# EAGLE design breakbeam (EAGLE 9.6.1)
DDRAWN: 11/27/2018; FINISH: HASL; MATERIAL: FR-4; NDRAWN: MM; REV: 1.0; REVISION: v1.1; SCALE: 1:1; TEAM: RoboCup; TITLE: SSL Breakbeam
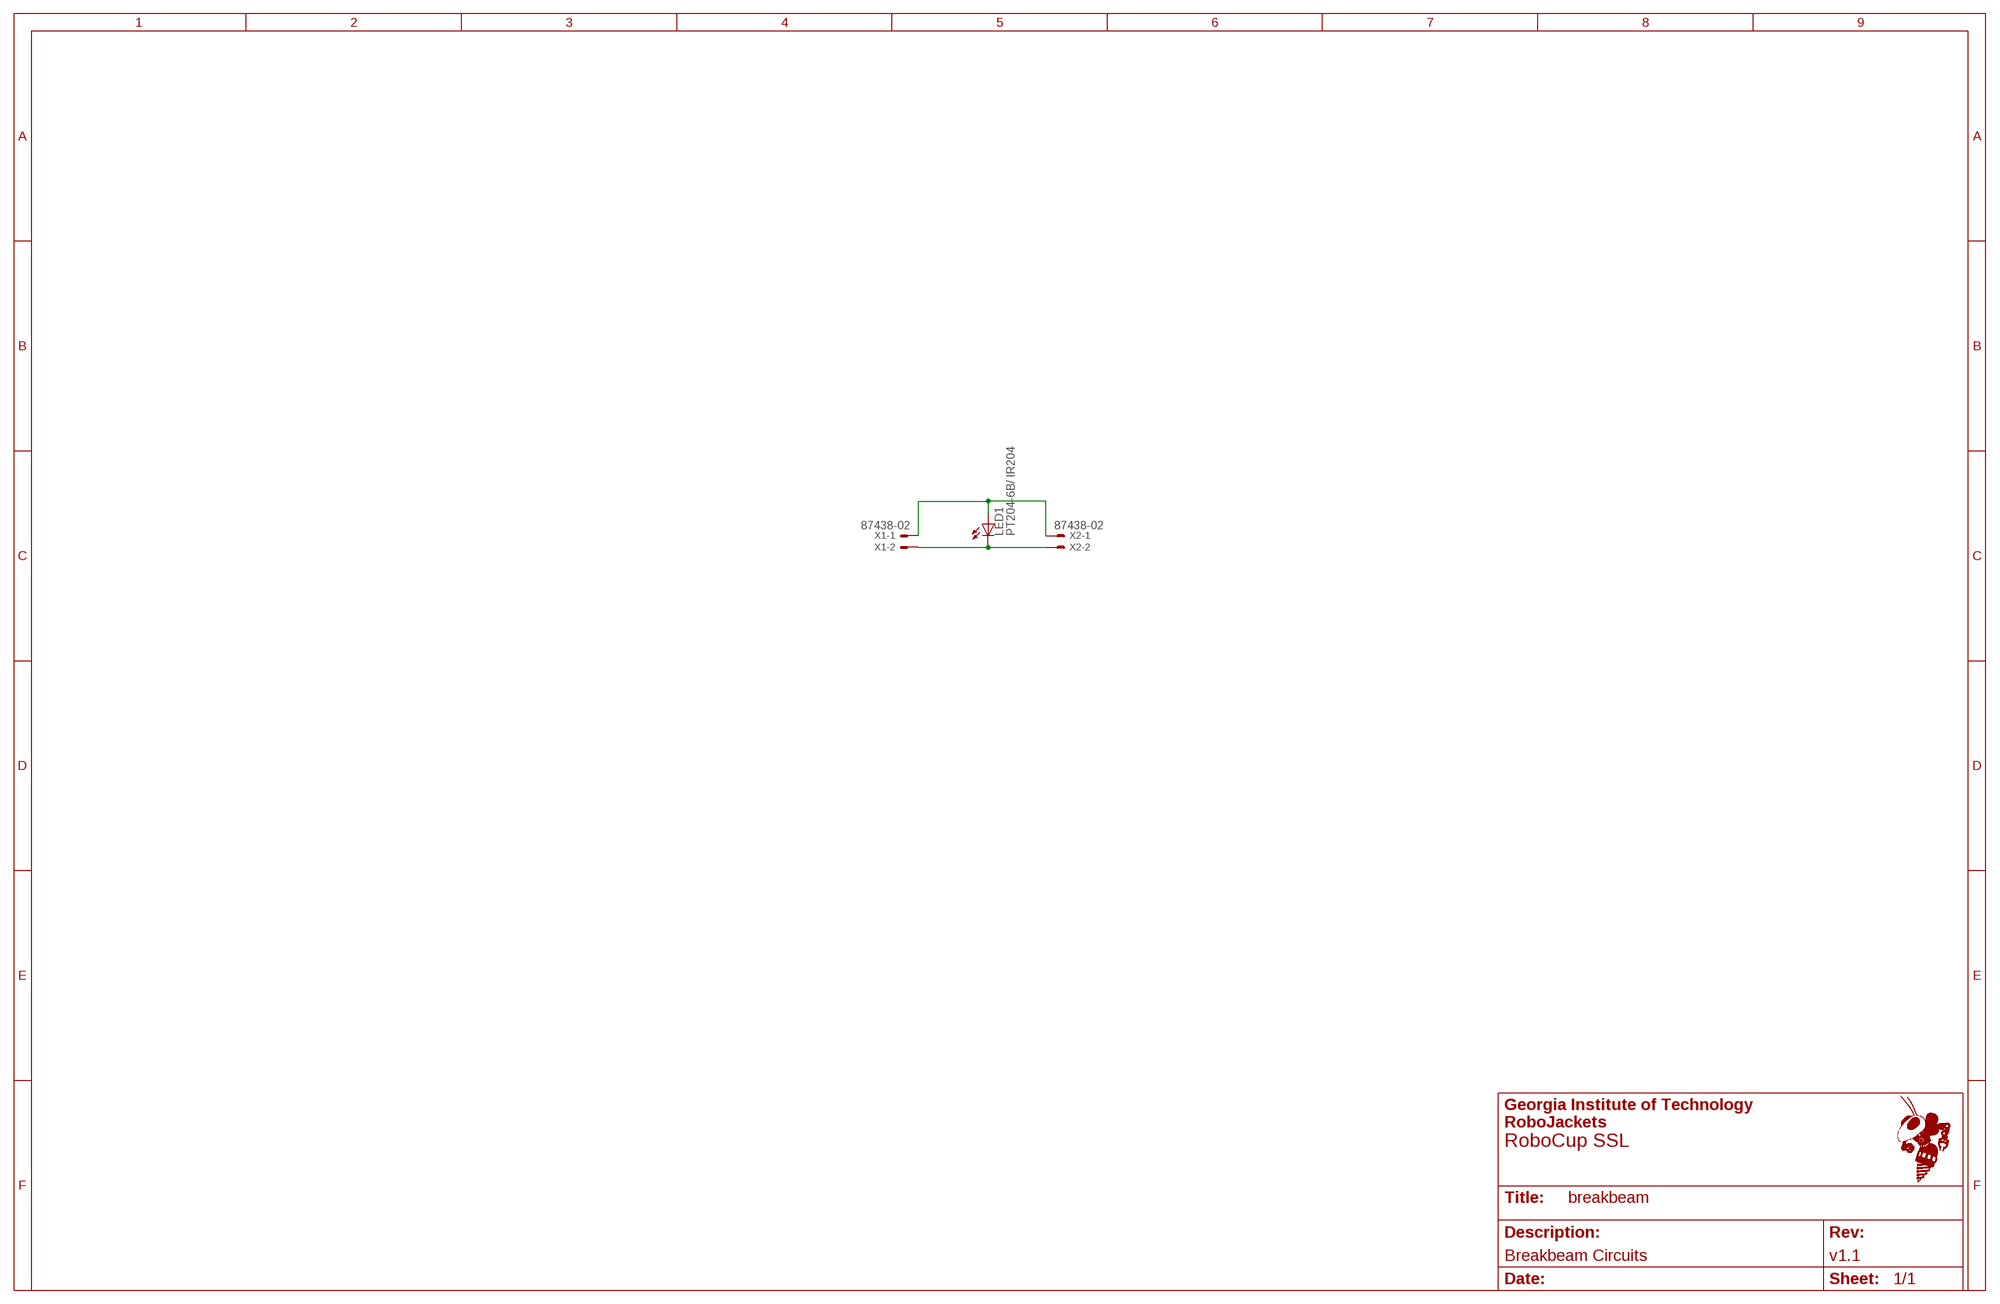
[diagram p0: schematic, sheet 1]
FRAME1 (FRAME_B_L): REVISION: v1.1; SCH_DESC: Breakbeam Circuits; TEAM: RoboCup SSL

## Parts
LED1  PT204-6B/ IR204  LED-TH  [LED3MM]
X1  87438-02  [87438-02]
X2  87438-02  [87438-02]

## Nets
ANODE: LED1.A X1.1 X2.1
CATHODE: LED1.K X1.2 X2.2

## Library data of the parts
LED1 = RoboJackets-LEDs:LED-TH
X1 X2 = RoboJackets-Connectors:87438-02: Wire-to-Board 1.50mm (.059") Pitch Header - Right Angle, SMT, Shrouded Source: http://www.molex.com/product/micro/87438.html; MF: MOLEX; OC_FARNELL: 1711327; OC_NEWARK: unknown

## Board
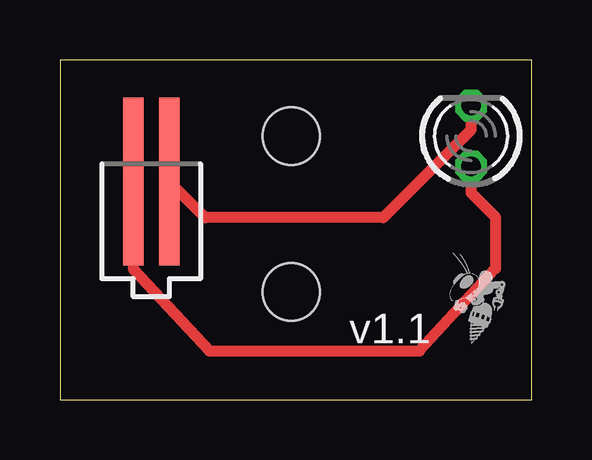
[diagram p1: board, top side]
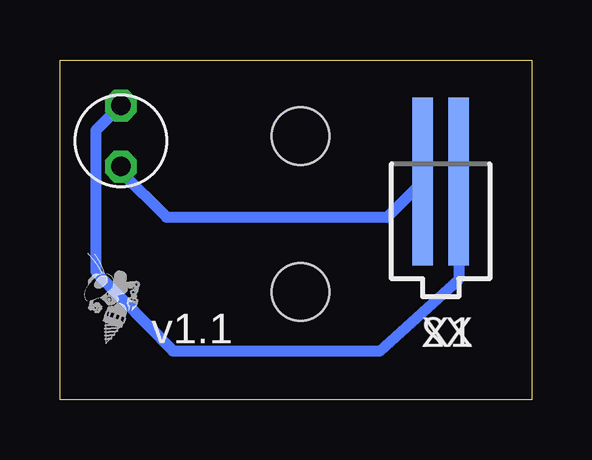
[diagram p2: board, bottom side, seen from below]

Size 19.68 x 14.17 mm. Coordinates in mm from the lower left corner, seen from the top.
Outline: 0,0 19.68,0 19.68,14.17 0,14.17 0,0
Copper layers (1*16): Top 0.035mm / dielectric 1.5mm / Bottom 0.035mm
Design rules "default": minimum track width 6mil, minimum drill 0.35mm, track to track 6mil, track to pad 6mil, pad to pad 6mil, via to via 6mil, smd to smd 6mil, copper to edge 40mil, drill to drill 6mil, minimum pad ring 10mil, minimum via ring 8mil, stop-mask expansion 4mil, vias tented up to drill 0mil, thermal gap 10mil
Holes 2.4 mm at 9.64,4.5 9.64,11

### Footprints (pad centres in the part's own frame; a part is rotated, then mirrored left to right if it is on the bottom)
LED3MM = drill 0.813 octagon: A -1.27,0; K 1.27,0
87438-02 = smd 7 x 0.85: 1 0,0.75; 2 0,-0.75

### Placement (x,y rotation side)
LED1  17.14,11 90 top
U$1  [ROBOBUZZ_0.2X]  17.14,2.34 0 top
U$4  [ROBOBUZZ_0.2X]  17.78,2.34 0 bottom
X1  3.81,9.09 90 bottom
X2  3.81,9.09 90 top

### Tracks (layer width: path | path; a pad name or v marks a point on that pad's centre or on a via)
ANODE
  Top 0.45: X2.1 3.06,5.45 6.24,2.03 15,2.03 18.16,5.47 18.16,7.62 17.14,8.64 LED1.A
  Bottom 0.45: X1.1 6.03,7.62 15.24,7.62 17.14,9.53 LED1.A
CATHODE
  Top 0.45: X2.2 6.06,7.59 13.49,7.59 17.14,11.25 LED1.K
  Bottom 0.45: X1.2 3.06,5.02 6.35,2.03 14.97,2.03 18.19,5.33 18.19,11.23 LED1.K